# Altium schematic sheet Connectors_Headers.SchDoc
size A4; SheetNumber: 3; SheetTotal: 6
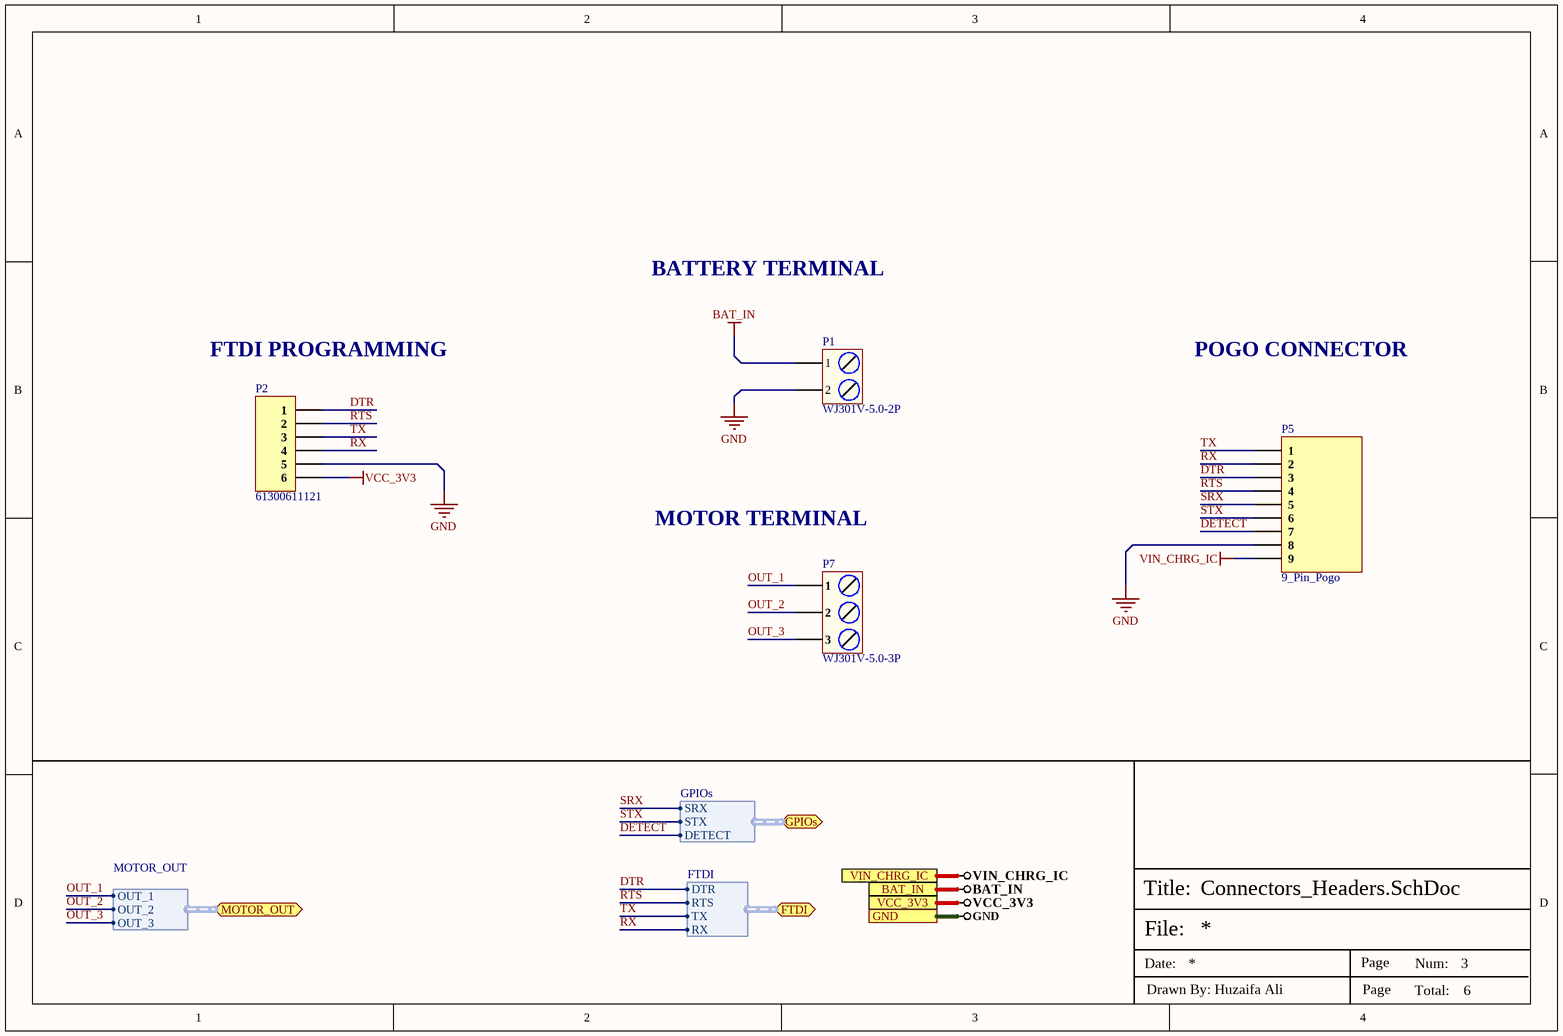
[diagram p0: Connectors_Headers.SchDoc]

## Parts
P1  WJ301V-5.0-2P  [WJ301V-5.0-2P]
P2  61300611121  [HDR1X6_]
P5  9_Pin_Pogo  [9_Pin_Pogo]
P7  WJ301V-5.0-3P  [WJ301V-5.0-3P]

## Ports
BAT_IN, FTDI (bidir, harness FTDI), GND, GPIOs (bidir, harness GPIOs), MOTOR_OUT (bidir, harness MOTOR_OUT), VCC_3V3, VIN_CHRG_IC

## Harnesses
FTDI: DTR, TX, RX, RTS
MOTOR_OUT: OUT_1, OUT_2, OUT_3
GPIOs: SRX, STX, DETECT

## Nets
BAT_IN: P1.1 ; port BAT_IN
GND: P1.2 P2.5 P5.8 ; port GND
VCC_3V3: P2.6 ; port VCC_3V3
VIN_CHRG_IC: P5.9 ; port VIN_CHRG_IC
DETECT: P5.7 ; port GPIOs.DETECT
DTR: P2.1 P5.3 ; port FTDI.DTR
OUT_1: P7.1 ; port MOTOR_OUT.OUT_1
OUT_2: P7.2 ; port MOTOR_OUT.OUT_2
OUT_3: P7.3 ; port MOTOR_OUT.OUT_3
RTS: P2.2 P5.4 ; port FTDI.RTS
RX: P2.4 P5.2 ; port FTDI.RX
SRX: P5.5 ; port GPIOs.SRX
STX: P5.6 ; port GPIOs.STX
TX: P2.3 P5.1 ; port FTDI.TX

## Notes on the sheet
- BATTERY TERMINAL
- (near P2) FTDI PROGRAMMING
- POGO CONNECTOR
- MOTOR TERMINAL
- File:
- Title:
- Date:
- Page
- Num:
- Total:
- Drawn By: Huzaifa Ali

## Library data of the parts
P1 = WJ301V-5.0-2P: P=5.0mm Screw terminal RoHS; Manufacturer: Ningbo Kangnex Elec; Value: Custom; Manufacturer Part No: WJ301V-5.0-2P; Package: Custom
P2 = 61300611121: CONN HEADER 6 POS 2.54; Manufacturer: Wurth Electronics; Current Rating: 3A; Voltage Rating: 250V; Number of Positions: 6; Gender: Male; Connector Type: Male Pin; Pitch: 0.1inch; Supplier 1: Newark; Manufacturer Part Number: 61300611121; RoHS: Yes; Category: Headers and Wire Housings; Stock 1: 4996; Pricing 1: 1=0.34000, 10=0.28900, 25=0.24000, 50=0.20100, 100=0.18200 (USD); Mount: Through Hole; Contact Plating: Gold; Contact Material: Copper Alloy,Copper; Housing Material: PBT; Color: Black; Min Operating Temperature: -40°C; Max Operating Temperature: 125°C; Number of Rows: 1; Contact Gender: Male; Packaging: Bulk; Termination: Through Hole; Number of Contacts: 6; Series: WR-PHD; Contact Type: Male Pin; Contact Mating Length: 0.236inch; REACH SVHC: Unknown; Lead Free: Lead Free; RoHS Compliant: Yes; ComponentLink1URL: http://www.mouser.com/ds/2/445/6130xx11121-538006.pdf?src-supplier=Mouser; ComponentLink1Description: http://www.mouser.com/ds/2/445/6130xx11121-538006.pdf?src-supplier=Mouser; ComponentLink2URL: http://www.farnell.com/cad/1737268.pdf?src-supplier=Element14; ComponentLink2Description: http://www.farnell.com/cad/1737268.pdf?src-supplier=Element14; ComponentLink3URL: https://katalog.we-online.de/em/datasheet/6130xx11121.pdf?src-supplier=Digi-Key; ComponentLink3Description: https://katalog.we-online.de/em/datasheet/6130xx11121.pdf?src-supplier=Digi-Key; Supplier Part Number 1: 20X0957
P7 = WJ301V-5.0-3P: P=5.0mm Screw terminal RoHS; Manufacturer: Ningbo Kangnex Elec; Manufacturer Part Number: WJ301V-5.0-3P; Package: Custom; LCSC Part Number: C8483; ComponentLink1Description: LCSC; ComponentLink1URL: https://www.lcsc.com/product-detail/Screw-terminal_Ningbo-Kangnex-Elec-WJ301V-5-0-3P_C8483.html